# Altium schematic sheet led_cc_driver_b.SchDoc
size 297 x 209 mm
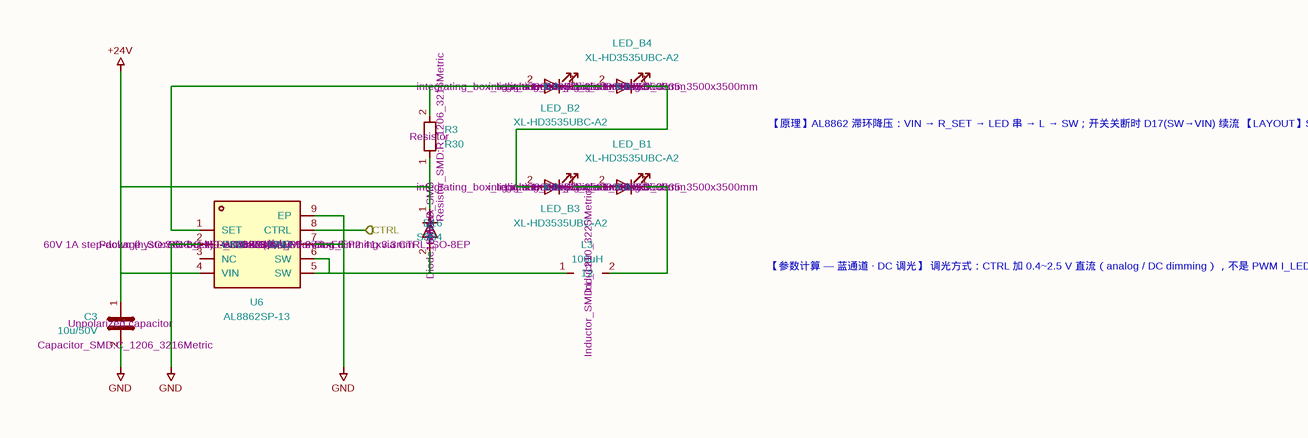
[diagram p0: led_cc_driver_b.SchDoc]

## Parts
C3  Description: Unpolarized capacitor  Footprint: Capacitor_SMD:C_1206_3216Metric  [C_1206_3216Metric]  (hidden comment: 10u/50V)
D16  Description: Diode  Sim.Pins: 1=K 2=A  Footprint: Diode_SMD:D_SMB  [D_SMB]  (hidden comment: SS34)
L3  Description: Inductor  Footprint: Inductor_SMD:L_1210_3225Metric  [L_1210_3225Metric]  (hidden comment: 100uH)
LED_B1  Description: Light emitting diode  Sim.Pins: 1=K 2=A  LCSC Part: C3646953  Footprint: integrating_box_light_source:LED_3535_3500x3500mm  [LED_3535_3500x3500mm]  (hidden comment: XL-HD3535UBC-A2)
LED_B2  Description: Light emitting diode  Sim.Pins: 1=K 2=A  LCSC Part: C3646953  Footprint: integrating_box_light_source:LED_3535_3500x3500mm  [LED_3535_3500x3500mm]  (hidden comment: XL-HD3535UBC-A2)
LED_B3  Description: Light emitting diode  Sim.Pins: 1=K 2=A  LCSC Part: C3646953  Footprint: integrating_box_light_source:LED_3535_3500x3500mm  [LED_3535_3500x3500mm]  (hidden comment: XL-HD3535UBC-A2)
LED_B4  Description: Light emitting diode  Sim.Pins: 1=K 2=A  LCSC Part: C3646953  Footprint: integrating_box_light_source:LED_3535_3500x3500mm  [LED_3535_3500x3500mm]  (hidden comment: XL-HD3535UBC-A2)
R3  Description: Resistor  Footprint: Resistor_SMD:R_1206_3216Metric  [R_1206_3216Metric]  (hidden comment: R30)
U6  Description: 60V 1A step-down (hysteretic buck) LED driver, PWM/analog dimming via CTRL, SO-8EP  LCSC Part: C526360  Manufacturer: DIODES(美台)  Package: SO-8_L4.9-W3.9-P1.27-LS6.0-BL-EP  Footprint: Package_SO:SOIC-8-1EP_3.9x4.9mm_P1.27mm_EP2.41x3.3mm  [SOIC-8-1EP_3.9x4.9mm_P1.27mm_EP2.41x3.3mm]  (hidden comment: AL8862SP-13)

## Ports
CTRL (in)

## Nets
+24V: C3.1 D16.1(K) R3.1 U6.4(VIN)
GND: C3.2 U6.2(GND) U6.7(GND) U6.9(EP)
CTRL: U6.8(CTRL) ; port CTRL
NetD16_2: D16.2(A) L3.1 U6.5(SW) U6.6(SW)
NetL3_2: L3.2 LED_B1.1(K)
NetLED_B1_2: LED_B1.2(A) LED_B3.1(K)
NetLED_B2_1: LED_B2.1(K) LED_B4.2(A)
NetLED_B2_2: LED_B2.2(A) R3.2 U6.1(SET)
NetLED_B3_2: LED_B3.2(A) LED_B4.1(K)

Not connected (* = marked no-connect by the designer): U6 3(NC)

## Notes on the sheet
- 【原理】AL8862 滞环降压：VIN → R_SET → LED 串 → L → SW；开关关断时 D17(SW→VIN) 续流
  【LAYOUT】SW→L/D 走线最短以降低 EMI；EP 大面积铺铜 + 散热过孔；R_SET 与 VIN/SET 用 Kelvin 接法
  【焊接】3535 灯珠回流焊 240±5℃/6s，只建议返修时手工焊（<300℃/3s）
- 【参数计算 — 蓝通道 · DC 调光】
  调光方式：CTRL 加 0.4~2.5 V 直流（analog / DC dimming），不是 PWM
  I_LED(100%) = 0.1/0.30 = 333 mA；ΔI = 26 mV/R_SET = 86.6 mA（VSET_HYS = ±13%，固定值）
  V_LED = 4×3.4 V = 13.6 V（蓝光 Vf 最高，留给恒流源余量最小）
  t_OFF = 100µ×86.6m/(13.6+0.5+0.13) = 610 ns
  t_ON = 8.66µ/(24−13.6−0.13) = 845 ns → f_SW = 687 kHz（满载 CCM）
  占空比 D = 13.6/24 = 0.57（四路最高）；母线降到 20 V 仍可调满
  调暗时纹波不降（ΔI 固定）→ 低亮段进 DCM，频率下降
- 1
- 2
- 3
- 4
- 5
- 6
- A
- B
- C
- 通道：蓝光 465nm / 4 颗 3535 串联
- IC：AL8862SP-13 (LCSC C526360)
- 灯珠：XL-HD3535UBC-A2 (LCSC C3646953)
- D
- Title: LED 恒流驱动 — 蓝光通道
- File: led_cc_driver_b.kicad_sch
- Sheet: /
- integrating_box_light_source
- KiCad E.D.A.  kicad (5.1.4)-1
- Size: A4
- Date: 2026-11-08
- Rev: A
- Id: 1/1

## Library data of the parts
C3 = C: Value: 10u/50V
D16 = D: Sim.Device: D; Value: SS34
L3 = L: Value: 100uH
LED_B1-LED_B4 = LED: Value: XL-HD3535UBC-A2
R3 = R: Value: R30
U6 = AL8862SP-13: MPN: AL8862SP-13; Value: AL8862SP-13